# Altium schematic sheet Relay-Sheet.SchDoc
size 420 x 297 mm; SheetNumber: 5; SheetTotal: 5
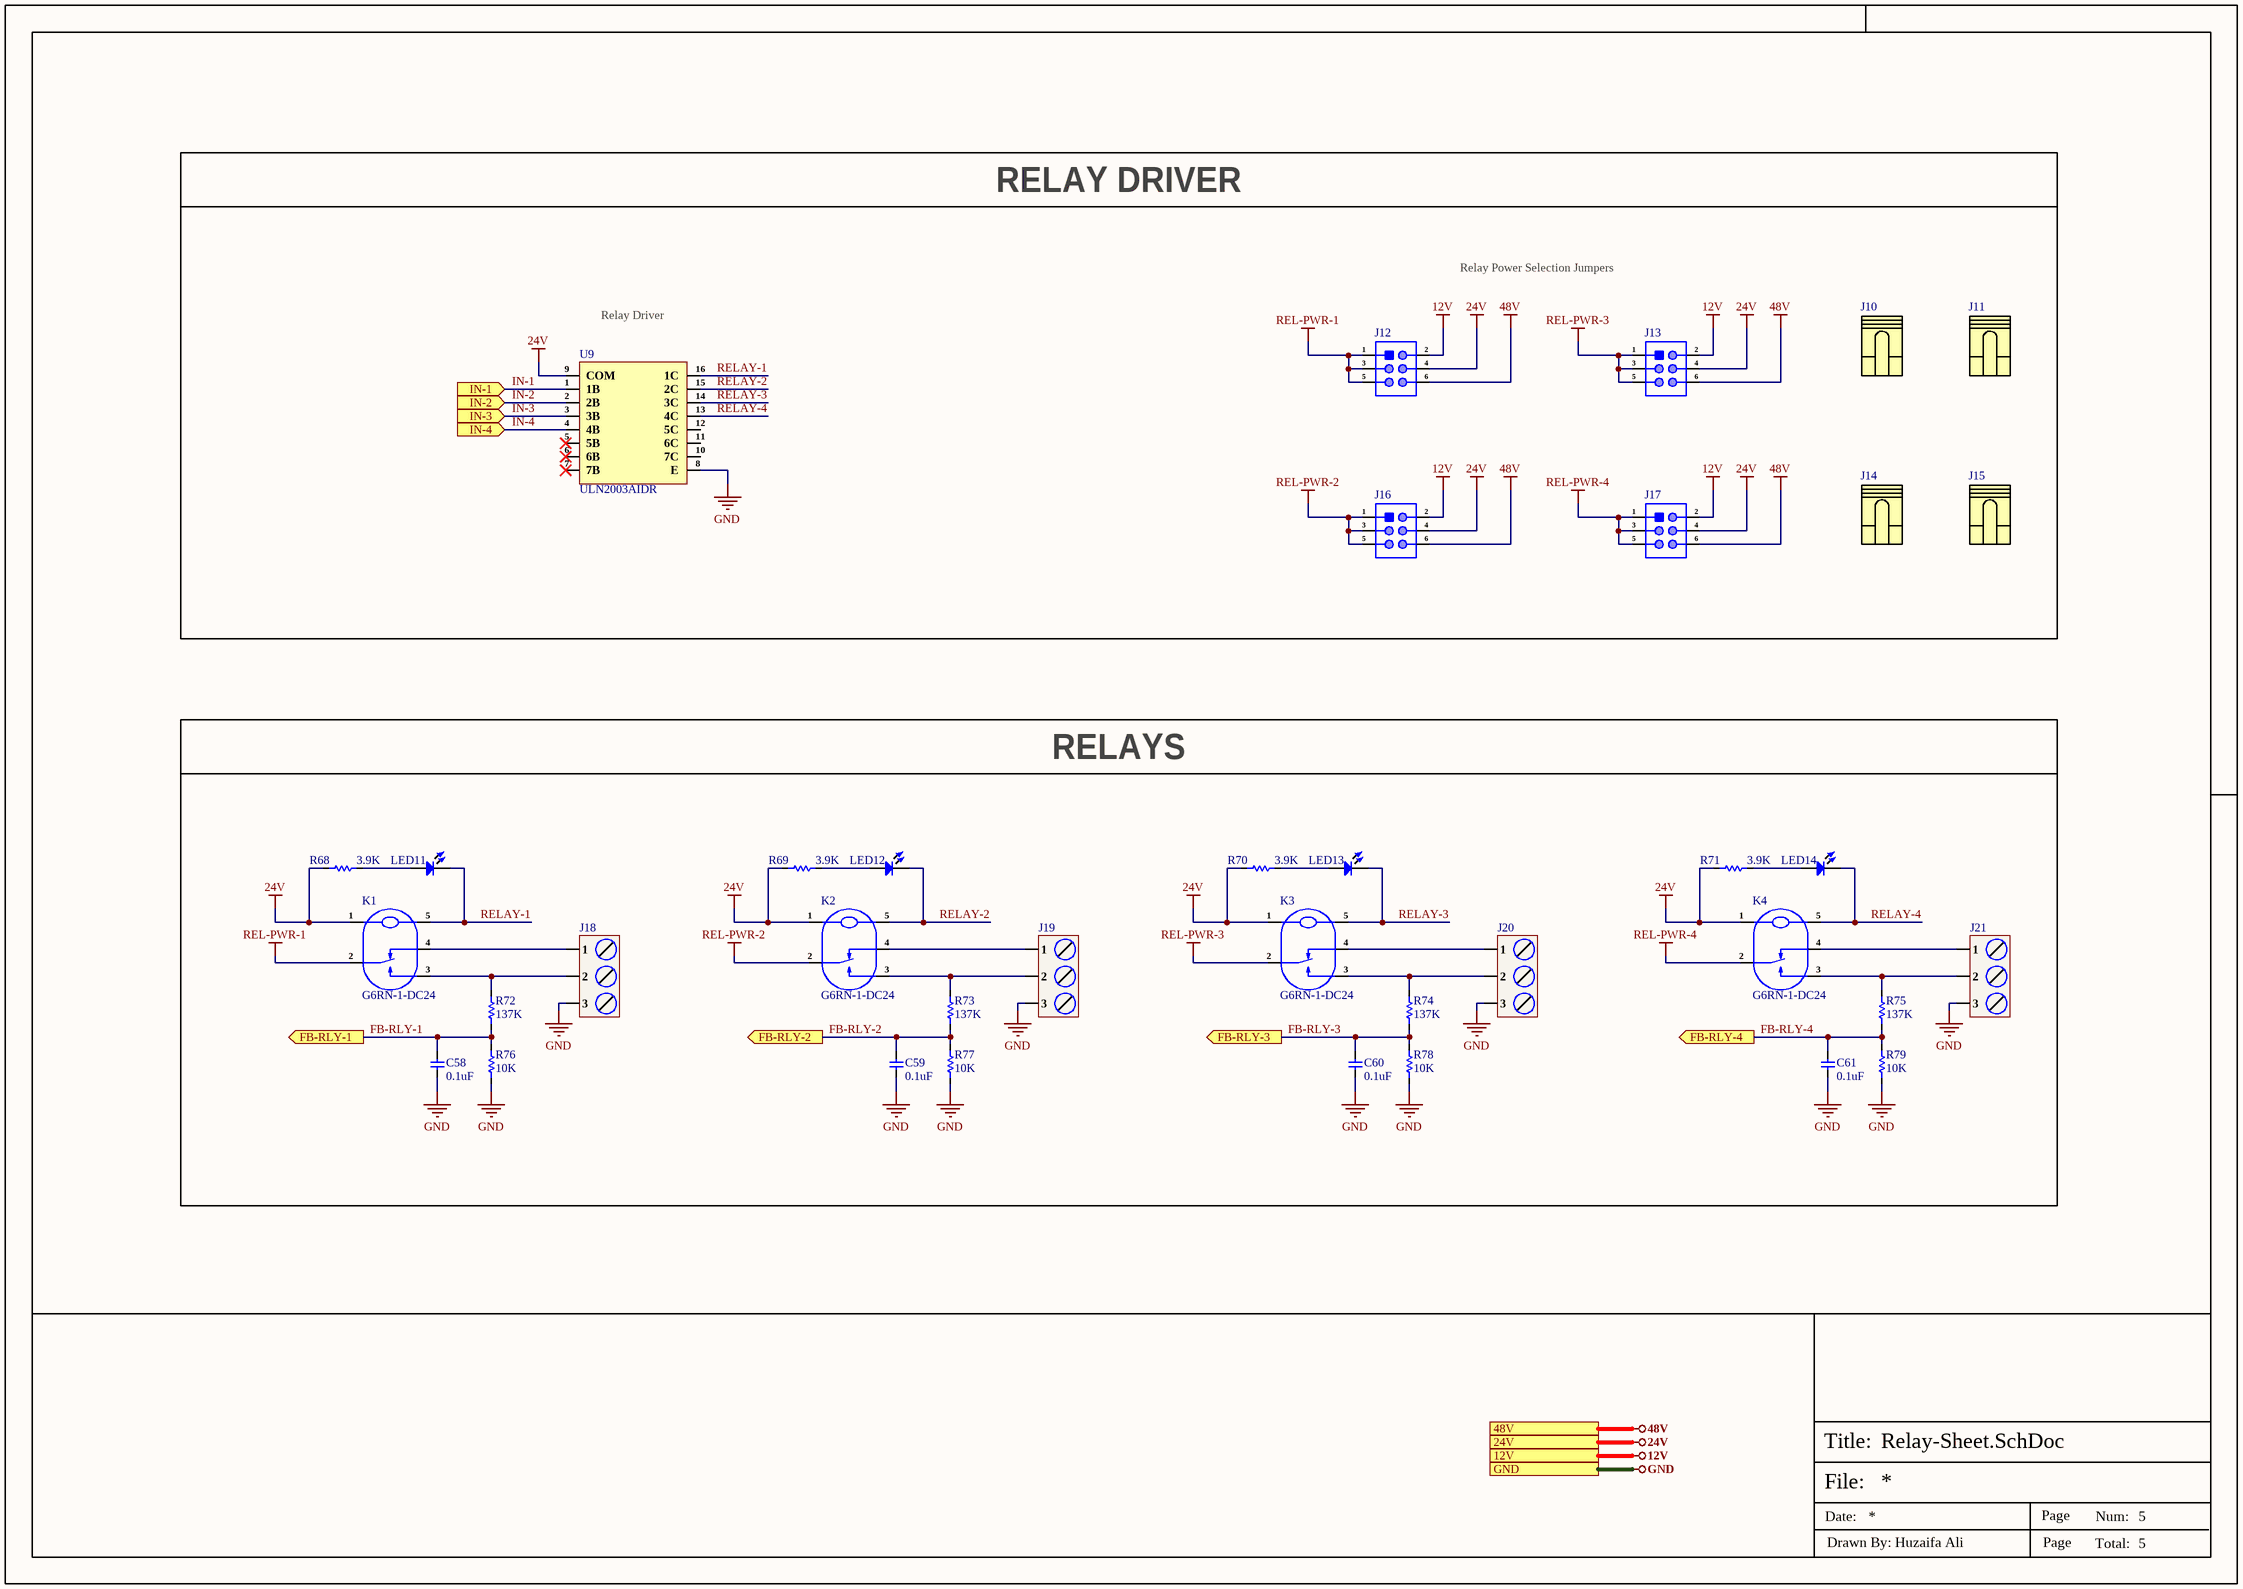
[diagram p0: Relay-Sheet.SchDoc]

## Parts
C58  0.1uF  [Cap-0603]
C59  0.1uF  [Cap-0603]
C60  0.1uF  [Cap-0603]
C61  0.1uF  [Cap-0603]
J10  Shunt (X2541-A1NIB)  (value not drawn)  (graphical)
J11  Shunt (X2541-A1NIB)  (value not drawn)  (graphical)
J12  X6521WV-2x03H-C60D30  [X6521WV-2x03H-C60D30]  (value not drawn)
J13  X6521WV-2x03H-C60D30  [X6521WV-2x03H-C60D30]  (value not drawn)
J14  Shunt (X2541-A1NIB)  (value not drawn)  (graphical)
J15  Shunt (X2541-A1NIB)  (value not drawn)  (graphical)
J16  X6521WV-2x03H-C60D30  [X6521WV-2x03H-C60D30]  (value not drawn)
J17  X6521WV-2x03H-C60D30  [X6521WV-2x03H-C60D30]  (value not drawn)
J18  DB128L-5.08-3P-GY-S  [DB128L-5.08-3P-GY-S]  (value not drawn)
J19  DB128L-5.08-3P-GY-S  [DB128L-5.08-3P-GY-S]  (value not drawn)
J20  DB128L-5.08-3P-GY-S  [DB128L-5.08-3P-GY-S]  (value not drawn)
J21  DB128L-5.08-3P-GY-S  [DB128L-5.08-3P-GY-S]  (value not drawn)
K1  G6RN-1-DC24  [G6RN-1 DC24]
K2  G6RN-1-DC24  [G6RN-1 DC24]
K3  G6RN-1-DC24  [G6RN-1 DC24]
K4  G6RN-1-DC24  [G6RN-1 DC24]
LED11  Blue  [LED-0603]  (value not drawn)
LED12  Blue  [LED-0603]  (value not drawn)
LED13  Blue  [LED-0603]  (value not drawn)
LED14  Blue  [LED-0603]  (value not drawn)
R68  3.9K  [Res-0402]
R69  3.9K  [Res-0402]
R70  3.9K  [Res-0402]
R71  3.9K  [Res-0402]
R72  137K  [Res-0402]
R73  137K  [Res-0402]
R74  137K  [Res-0402]
R75  137K  [Res-0402]
R76  10K  [Res-0402]
R77  10K  [Res-0402]
R78  10K  [Res-0402]
R79  10K  [Res-0402]
U9  ULN2003AIDR  [16-SOIC (0.154", 3.90mm Width)]

## Blocks framed on the sheet
RELAY DRIVER: J10-J17 U9
RELAYS: C58-C61 J18-J21 K1-K4 LED11-LED14 R68-R79

## Ports
12V (see Top-Sheet[5B], Power-Sheet[4D]), 24V (see Top-Sheet[5B], Power-Sheet[4D]), 48V (see Top-Sheet[5B], Power-Sheet[4D]), FB-RLY-1 (out, see Top-Sheet[4B]), FB-RLY-2 (out, see Top-Sheet[4B]), FB-RLY-3 (out, see Top-Sheet[4B]), FB-RLY-4 (out, see Top-Sheet[4B]), GND (see Top-Sheet[5B], Comms-Sheet[4D], Controller-Sheet[4D], Power-Sheet[4D]), IN-1 (in, see Top-Sheet[4B]), IN-2 (in, see Top-Sheet[4B]), IN-3 (in, see Top-Sheet[4B]), IN-4 (in, see Top-Sheet[4B])

## Nets
12V: J12.2 J13.2 J16.2 J17.2 ; port 12V
24V: J12.4 J13.4 J16.4 J17.4 K1.1 K2.1 K3.1 K4.1 R68.1 R69.1 R70.1 R71.1 U9.9(COM) ; port 24V
48V: J12.6 J13.6 J16.6 J17.6 ; port 48V
GND: C58.1 C59.1 C60.1 C61.1 J18.3 J19.3 J20.3 J21.3 R76.1 R77.1 R78.1 R79.1 U9.8(E) ; port GND
REL-PWR-1: J12.1 J12.3 J12.5 K1.2
REL-PWR-2: J16.1 J16.3 J16.5 K2.2
REL-PWR-3: J13.1 J13.3 J13.5 K3.2
REL-PWR-4: J17.1 J17.3 J17.5 K4.2
FB-RLY-1: C58.2 R72.1 R76.2 ; port FB-RLY-1
FB-RLY-2: C59.2 R73.1 R77.2 ; port FB-RLY-2
FB-RLY-3: C60.2 R74.1 R78.2 ; port FB-RLY-3
FB-RLY-4: C61.2 R75.1 R79.2 ; port FB-RLY-4
IN-1: U9.1(1B) ; port IN-1
IN-2: U9.2(2B) ; port IN-2
IN-3: U9.3(3B) ; port IN-3
IN-4: U9.4(4B) ; port IN-4
RELAY-1: K1.5 LED11.2 U9.16(1C)
RELAY-2: K2.5 LED12.2 U9.15(2C)
RELAY-3: K3.5 LED13.2 U9.14(3C)
RELAY-4: K4.5 LED14.2 U9.13(4C)
NetJ18_1: J18.1 K1.4
NetJ18_2: J18.2 K1.3 R72.2
NetJ19_1: J19.1 K2.4
NetJ19_2: J19.2 K2.3 R73.2
NetJ20_1: J20.1 K3.4
NetJ20_2: J20.2 K3.3 R74.2
NetJ21_1: J21.1 K4.4
NetJ21_2: J21.2 K4.3 R75.2
NetLED11_1: LED11.1 R68.2
NetLED12_1: LED12.1 R69.2
NetLED13_1: LED13.1 R70.2
NetLED14_1: LED14.1 R71.2

Not connected (* = marked no-connect by the designer): U9 5(5B)* 6(6B)* 7(7B)* 10(7C) 11(6C) 12(5C)

## Notes on the sheet
- Relay Power Selection Jumpers
- Relay Driver
- File:
- Title:
- Date:
- Page
- Num:
- Total:
- Drawn By: Huzaifa Ali

## Library data of the parts
C58-C61 = CC0603KRX7R0BB104: CAP CER 0.1UF 100V X7R 0603; Manufacturer: Yageo; Capacitance: 100nF; Tolerance: 10%; Item Type: Capacitor; Supplier 1: Digi-Key; Manufacturer Part Number: CC0603KRX7R0BB104; RoHS: Yes; Category: Ceramic Capacitors; Stock 1: 60476; Pricing 1: 1=0.19000, 10=0.13500, 50=0.07680, 100=0.06370, 500=0.04466, 1000=0.03696 (USD); Mount: Surface Mount; Case/Package: 0603; Case Code (Metric): 1608; Case Code (Imperial): 0603; Weight: 7.1E-05oz; Min Operating Temperature: -55°C; Max Operating Temperature: 125°C; Package Quantity: 4000; Voltage Rating: 100V; Packaging: Tape and Reel; Dielectric: X7R; Termination: SMD/SMT; Resistor Type: Ceramic; Voltage Rating (DC): 100V; Series: CC; Length: 0.063inch; Width: 0.031inch; Thickness: 0.035inch; Depth: 0.8mm; Lead Free: Lead Free; RoHS Compliant: Yes; ComponentLink1URL: https://datasheet.ciiva.com/6277/mlccorderingcode-6277030.pdf?src-supplier=Digi-Key; ComponentLink1Description: https://datasheet.ciiva.com/6277/mlccorderingcode-6277030.pdf?src-supplier=Digi-Key; ComponentLink2URL: https://datasheet.ciiva.com/6277/mlccorderingcode-6277081.pdf?src-supplier=Digi-Key; ComponentLink2Description: https://datasheet.ciiva.com/6277/mlccorderingcode-6277081.pdf?src-supplier=Digi-Key; ComponentLink3URL: https://datasheet.ciiva.com/6277/mlccorderingcode-6277082.pdf?src-supplier=Digi-Key; ComponentLink3Description: https://datasheet.ciiva.com/6277/mlccorderingcode-6277082.pdf?src-supplier=Digi-Key; Supplier Part Number 1: 311-1523-1-ND; LCSC Part Number: C113803
J10 J11 J14 J15 = Shunt (X2541-A1NIB): Open top 3A 2.54mm P=2.54mm Shunts, Jumpers ROHS; Manufacturer: XKB Connection; Item Type: Jumper; Manufacturer Part Number: X2541-A1NIB; Package: P=2.54mm; LCSC Part Number: C2938578; ComponentLink1Description: LCSC; ComponentLink1URL: https://www.lcsc.com/product-detail/Shunts-Jumpers_XKB-Connection-X2541-A1NIB_C2938578.html
J12 J13 J16 J17 = X6521WV-2x03H-C60D30: Gold 250V 3A Policy 2.5mm 6P -40℃~+105℃ 2.54mm Double Row Black Brass 2x3P 2.54mm Plugin,P=2.54mm Pin Headers ROHS; Manufacturer: XKB; Item Type: Male Pin Header; Manufacturer Part Number: X6521WV-2x03H-C60D30; Package: Plugin,P=2.54mm; LCSC Part Number: C706893; ComponentLink1Description: LCSC; ComponentLink1URL: https://www.lcsc.com/product-detail/Pin-Headers_XKB-Connection-X6521WV-2x03H-C60D30_C706893.html
J18-J21 = DB128L-5.08-3P-GY-S: 1x3P 20A -40℃~+105℃ 300V Gray 12~30 Direct Insert 5.08mm 1~2.5 1 3 Plugin,P=5.08mm Screw Terminal Blocks ROHS; Manufacturer: DORABO; Manufacturer Part Number: DB128L-5.08-3P-GY-S; Package: Plugin,P=5.08mm; LCSC Part Number: C500022; Item Type: Terminal Block; ComponentLink1Description: LCSC; ComponentLink1URL: https://www.lcsc.com/product-detail/Screw-Terminal-Blocks_DORABO-DB128L-5-08-3P-GY-S_C500022.html
K1-K4 = G6RN-1-DC24: RELAY GEN PURPOSE SPDT 8A 24V; Manufacturer: Omron; Item Type: Relays; Supplier: Rs; LCSC Part Number: C397134; Manufacturer Part Number: G6RN-1-DC24; RoHS: Yes; Stock: 2257; ComponentLink1URL: https://datasheet.ciiva.com/26921/getdatasheetpartid-770308-26921141.pdf?src-supplier=Verical; ComponentLink1Description: https://datasheet.ciiva.com/26921/getdatasheetpartid-770308-26921141.pdf?src-supplier=Verical; ComponentLink2URL: https://datasheet.ciiva.com/8000/1533700-8000602.pdf?src-supplier=Element14; ComponentLink2Description: https://datasheet.ciiva.com/8000/1533700-8000602.pdf?src-supplier=Element14; ComponentLink3URL: https://datasheet.ciiva.com/30072/en-g6rn-30072442.pdf?src-supplier=Onlinecomponents.com; ComponentLink3Description: https://datasheet.ciiva.com/30072/en-g6rn-30072442.pdf?src-supplier=Onlinecomponents.com; ComponentLink4URL: https://datasheet.ciiva.com/5232/g6rn-0911-5232733.pdf?src-supplier=Mouser; ComponentLink4Description: https://datasheet.ciiva.com/5232/g6rn-0911-5232733.pdf?src-supplier=Mouser
LED11-LED14 = NCD0603B3: blue 0603 Light Emitting Diodes (LED) ROHS; Manufacturer: Foshan NationStar Optoelectronics; Manufacturer Part Number: NCD0603B3; Package: 0603; LCSC Part Number: C158101; Item Type: LED; ComponentLink1Description: LCSC; ComponentLink1URL: https://www.lcsc.com/product-detail/Light-Emitting-Diodes-LED_Foshan-NationStar-Optoelectronics-NCD0603B3_C158101.html
R68-R71 = RC0402FR-073K9L: RES 3.9K OHM 1% 1/16W 0402; Manufacturer: Yageo; Temperature Coefficient: 100ppm/°C; Power Rating: 62.5mW; Value: 3.9kR; Voltage Rating: 50V; Max Power Dissipation: 63mW; Item Type: Resistor; Supplier: Future Electronics; Supplier Part Number: 9808155; Manufacturer Part Number: RC0402FR-073K9L; RoHS: Yes; Category: Chip SMD Resistors; Stock: 6910000; Pricing: 10000=0.0011, 100000=0.0011, 300000=0.001, 750000=0.001, 2000000=0.0009 (USD); Case/Package: 0402; Case Code (Imperial): 0402; Case Code (Metric): 1005; Min Operating Temperature: -55°C; Max Operating Temperature: 155°C; Tolerance: 1%; Packaging: Tape and Reel; Resistor Type: Thick Film; Series: RC; Termination: SMD/SMT; Number of Terminations: 2; Features: Moisture Resistant; Resistance Tolerance: 1%; Construction: Rectangular; Voltage Rating (AC): 50V; Length: 1mm; Depth: 0.5mm; Lead Free: Lead Free; RoHS Compliant: Yes; Reach SVHC Compliant: Unknown; Military Standard: Not; ComponentLink1URL: https://datasheet.ciiva.com/12666/pyu-rc0402-51-rohs-l-6-r-12666997.pdf?src-supplier=Mouser; ComponentLink1Description: https://datasheet.ciiva.com/12666/pyu-rc0402-51-rohs-l-6-r-12666997.pdf?src-supplier=Mouser; ComponentLink2URL: https://datasheet.ciiva.com/7849/1018594-7849989.pdf?src-supplier=Element14; ComponentLink2Description: https://datasheet.ciiva.com/7849/1018594-7849989.pdf?src-supplier=Element14; ComponentLink3URL: https://datasheet.ciiva.com/7849/1018594-7849990.pdf?src-supplier=Element14; ComponentLink3Description: https://datasheet.ciiva.com/7849/1018594-7849990.pdf?src-supplier=Element14; ComponentLink4URL: https://datasheet.ciiva.com/15189/getdatasheetpartid-469246-15189453.pdf?src-supplier=Verical; ComponentLink4Description: https://datasheet.ciiva.com/15189/getdatasheetpartid-469246-15189453.pdf?src-supplier=Verical; LCSC Part Number: C131467
R72-R75 = RT0402BRD07137KL: RES SMD 137K OHM 0.1% 1/16W 0402; Manufacturer: Yageo; Item Type: Resistors; Value: 137kR; Max Power Dissipation: 63mW; Temperature Coefficient: 25ppm/°C; Voltage Rating: 50V; Supplier: Digikey; LCSC Part Number: C852519; Manufacturer Part Number: RT0402BRD07137KL; RoHS: Yes; Stock: 18830; Pricing: 1=0.2, 10=0.15, 50=0.1174, 100=0.1051, 500=0.07972, 1000=0.07035, 5000=0.05199 (USD); Case/Package: 0402; Min Operating Temperature: -55°C; Max Operating Temperature: 155°C; Packaging: Tape and Reel; Number of Terminations: 2; Tolerance: 0.1%; Features: Moisture Resistant; Series: RT; Length: 0.039inch; Width: 0.02inch; Height: 0.014inch; ComponentLink1URL: http://www.yageo.com/documents/recent/PYu-RT_1-to-0.01_RoHS_L_8.pdf?src-supplier=Digikey; ComponentLink1Description: http://www.yageo.com/documents/recent/PYu-RT_1-to-0.01_RoHS_L_8.pdf?src-supplier=Digikey
R76-R79 = RT0402BRD0710KL: RES SMD 10K OHM 0.1% 1/16W 0402; Manufacturer: Yageo; Item Type: Resistor; Supplier: Future Electronics; Supplier Part Number: 1236728; Manufacturer Part Number: RT0402BRD0710KL; RoHS: Yes; Category: Chip SMD Resistors; Stock: 490000; Pricing: 10000=0.0218, 20000=0.0213, 30000=0.021, 50000=0.0206, 100000=0.0199 (USD); ComponentLink1URL: https://datasheet.ciiva.com/12836/pyu-rt-1-to-0-05-rohs-l-4-12836454.pdf?src-supplier=Mouser; ComponentLink1Description: https://datasheet.ciiva.com/12836/pyu-rt-1-to-0-05-rohs-l-4-12836454.pdf?src-supplier=Mouser; LCSC Part Number: C190095
U9 = ULN2003AIDR: IC PWR RELAY 7NPN 1:1 16SOIC; Manufacturer: Texas Instruments; Supplier: Mouser; Supplier Part Number: 595-ULN2003AIDR; Manufacturer Part Number: ULN2003AIDR; RoHS: Yes; Item Type: IC; Stock: 2012; Pricing: 1=0.66, 10=0.589, 50=0.589, 100=0.402, 1000=0.285, 10000=0.232 (USD); ComponentLink1URL: https://datasheet.ciiva.com/15139/getdatasheetpartid-47948-15139878.pdf?src-supplier=Verical; ComponentLink1Description: https://datasheet.ciiva.com/15139/getdatasheetpartid-47948-15139878.pdf?src-supplier=Verical; ComponentLink2URL: https://datasheet.ciiva.com/14424/ulq2003a-14424030.pdf?src-supplier=Avnet; ComponentLink2Description: https://datasheet.ciiva.com/14424/ulq2003a-14424030.pdf?src-supplier=Avnet; ComponentLink3URL: https://datasheet.ciiva.com/1700/uln2003ai-1700820.pdf?src-supplier=Digikey; ComponentLink3Description: https://datasheet.ciiva.com/1700/uln2003ai-1700820.pdf?src-supplier=Digikey; ComponentLink4URL: https://datasheet.ciiva.com/1700/uln2003ai-1700821.pdf?src-supplier=Digikey; ComponentLink4Description: https://datasheet.ciiva.com/1700/uln2003ai-1700821.pdf?src-supplier=Digikey; ComponentLink5URL: https://datasheet.ciiva.com/1700/uln2003ai-1700822.pdf?src-supplier=Digikey; ComponentLink5Description: https://datasheet.ciiva.com/1700/uln2003ai-1700822.pdf?src-supplier=Digikey